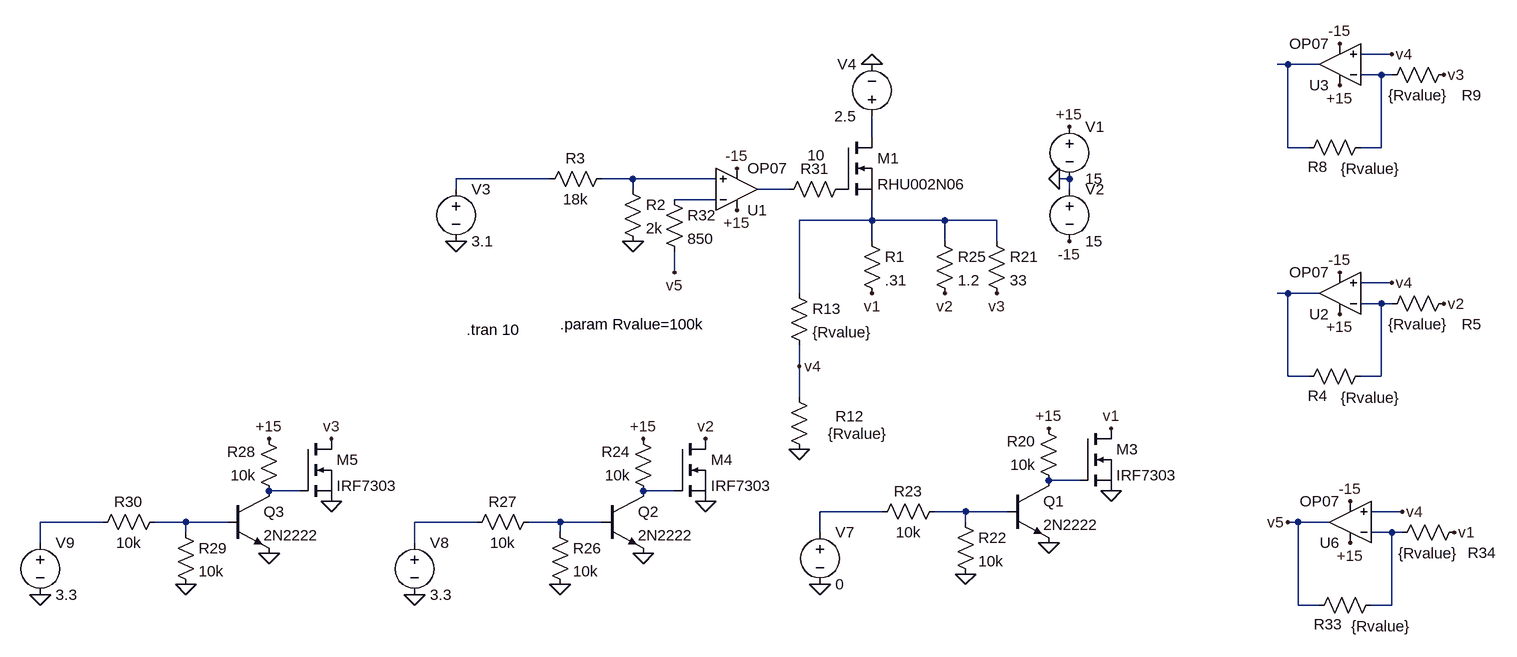
[diagram p0: schematic continuous.asc]
continuous.asc, the LTspice schematic file:
Version 4
SHEET 1 1420 1188
WIRE 1232 -80 1184 -80
WIRE 1072 -64 1056 -64
WIRE 1120 -64 1072 -64
WIRE 1216 -48 1184 -48
WIRE 1232 -48 1216 -48
WIRE 432 48 432 16
WIRE 1072 64 1072 -64
WIRE 1104 64 1072 64
WIRE 1216 64 1216 -48
WIRE 1216 64 1184 64
WIRE -64 112 -208 112
WIRE 64 112 16 112
WIRE 192 112 64 112
WIRE 736 112 720 112
WIRE -208 128 -208 112
WIRE 64 128 64 112
WIRE 304 128 256 128
WIRE 736 128 736 112
WIRE 192 144 128 144
WIRE 432 176 432 144
WIRE 432 176 320 176
WIRE 544 176 432 176
WIRE 624 176 544 176
WIRE 432 208 432 176
WIRE 544 208 544 176
WIRE 624 208 624 176
WIRE 128 256 128 224
WIRE 1232 272 1184 272
WIRE 320 288 320 176
WIRE 1072 288 1056 288
WIRE 1120 288 1072 288
WIRE 1216 304 1184 304
WIRE 1232 304 1216 304
WIRE 320 400 320 368
WIRE 1072 416 1072 288
WIRE 1104 416 1072 416
WIRE 1216 416 1216 304
WIRE 1216 416 1184 416
WIRE 320 448 320 400
WIRE 752 576 704 576
WIRE -448 592 -496 592
WIRE 128 592 80 592
WIRE 448 624 352 624
WIRE 576 624 528 624
WIRE 640 624 576 624
WIRE 1248 624 1200 624
WIRE -752 640 -848 640
WIRE -624 640 -672 640
WIRE -560 640 -624 640
WIRE -176 640 -272 640
WIRE -48 640 -96 640
WIRE 16 640 -48 640
WIRE 576 640 576 624
WIRE 1088 640 1072 640
WIRE 1136 640 1088 640
WIRE -624 656 -624 640
WIRE -48 656 -48 640
WIRE 352 656 352 624
WIRE 1232 656 1200 656
WIRE 1248 656 1232 656
WIRE -848 672 -848 640
WIRE -272 672 -272 640
WIRE 1088 768 1088 640
WIRE 1120 768 1088 768
WIRE 1232 768 1232 656
WIRE 1232 768 1200 768
FLAG 720 112 0
FLAG 736 32 +15
FLAG 736 208 -15
FLAG 224 160 +15
FLAG 224 96 -15
FLAG -208 208 0
FLAG 432 -64 0
FLAG 64 208 0
FLAG 800 496 v1
FLAG 800 592 0
FLAG 704 496 +15
FLAG 704 672 0
FLAG 576 720 0
FLAG 352 736 0
FLAG 176 608 0
FLAG 80 512 +15
FLAG 80 688 0
FLAG -48 736 0
FLAG -272 752 0
FLAG -400 608 0
FLAG -496 512 +15
FLAG -496 688 0
FLAG -624 736 0
FLAG -848 752 0
FLAG 544 288 v2
FLAG 624 288 v3
FLAG 320 400 v4
FLAG 128 256 v5
FLAG 176 512 v2
FLAG -400 512 v3
FLAG 1072 640 v5
FLAG 1168 672 +15
FLAG 1168 608 -15
FLAG 1248 624 v4
FLAG 1328 656 v1
FLAG 432 288 v1
FLAG 1152 320 +15
FLAG 1152 256 -15
FLAG 1232 272 v4
FLAG 1152 -32 +15
FLAG 1152 -96 -15
FLAG 1232 -80 v4
FLAG 1312 304 v2
FLAG 1312 -48 v3
FLAG 320 528 0
SYMBOL Opamps\\OP07 224 192 M180
SYMATTR InstName U1
SYMBOL voltage 736 16 R0
WINDOW 123 0 0 Left 0
WINDOW 39 0 0 Left 0
SYMATTR InstName V1
SYMATTR Value 15
SYMBOL voltage 736 112 R0
WINDOW 123 0 0 Left 0
WINDOW 39 0 0 Left 0
SYMATTR InstName V2
SYMATTR Value 15
SYMBOL nmos 384 48 R0
SYMATTR InstName M1
SYMATTR Value RHU002N06
SYMBOL res 416 192 R0
SYMATTR InstName R1
SYMATTR Value .31
SYMBOL voltage -208 112 R0
WINDOW 123 0 0 Left 0
WINDOW 39 0 0 Left 0
SYMATTR InstName V3
SYMATTR Value 3.1
SYMBOL voltage 432 32 R180
WINDOW 0 24 96 Left 2
WINDOW 3 24 16 Left 2
WINDOW 123 0 0 Left 0
WINDOW 39 0 0 Left 0
SYMATTR InstName V4
SYMATTR Value 2.5
SYMBOL res 48 112 R0
SYMATTR InstName R2
SYMATTR Value 2k
SYMBOL res 32 96 R90
WINDOW 0 0 56 VBottom 2
WINDOW 3 32 56 VTop 2
SYMATTR InstName R3
SYMATTR Value 18k
SYMBOL res 528 192 R0
SYMATTR InstName R25
SYMATTR Value 1.2
SYMBOL res 608 192 R0
SYMATTR InstName R21
SYMATTR Value 33
SYMBOL nmos 752 496 R0
SYMATTR InstName M3
SYMATTR Value IRF7303
SYMBOL npn 640 576 R0
SYMATTR InstName Q1
SYMATTR Value 2N2222
SYMBOL res 720 592 R180
WINDOW 0 36 76 Left 2
WINDOW 3 36 40 Left 2
SYMATTR InstName R20
SYMATTR Value 10k
SYMBOL res 560 624 R0
SYMATTR InstName R22
SYMATTR Value 10k
SYMBOL res 544 608 R90
WINDOW 0 0 56 VBottom 2
WINDOW 3 32 56 VTop 2
SYMATTR InstName R23
SYMATTR Value 10k
SYMBOL voltage 352 640 R0
WINDOW 123 0 0 Left 0
WINDOW 39 0 0 Left 0
SYMATTR InstName V7
SYMATTR Value 0
SYMBOL nmos 128 512 R0
SYMATTR InstName M4
SYMATTR Value IRF7303
SYMBOL npn 16 592 R0
SYMATTR InstName Q2
SYMATTR Value 2N2222
SYMBOL res 96 608 R180
WINDOW 0 36 76 Left 2
WINDOW 3 36 40 Left 2
SYMATTR InstName R24
SYMATTR Value 10k
SYMBOL res -64 640 R0
SYMATTR InstName R26
SYMATTR Value 10k
SYMBOL res -80 624 R90
WINDOW 0 0 56 VBottom 2
WINDOW 3 32 56 VTop 2
SYMATTR InstName R27
SYMATTR Value 10k
SYMBOL voltage -272 656 R0
WINDOW 123 0 0 Left 0
WINDOW 39 0 0 Left 0
SYMATTR InstName V8
SYMATTR Value 3.3
SYMBOL nmos -448 512 R0
SYMATTR InstName M5
SYMATTR Value IRF7303
SYMBOL npn -560 592 R0
SYMATTR InstName Q3
SYMATTR Value 2N2222
SYMBOL res -480 608 R180
WINDOW 0 36 76 Left 2
WINDOW 3 36 40 Left 2
SYMATTR InstName R28
SYMATTR Value 10k
SYMBOL res -640 640 R0
SYMATTR InstName R29
SYMATTR Value 10k
SYMBOL res -656 624 R90
WINDOW 0 0 56 VBottom 2
WINDOW 3 32 56 VTop 2
SYMATTR InstName R30
SYMATTR Value 10k
SYMBOL voltage -848 656 R0
WINDOW 123 0 0 Left 0
WINDOW 39 0 0 Left 0
SYMATTR InstName V9
SYMATTR Value 3.3
SYMBOL res 400 112 R90
WINDOW 0 0 56 VBottom 2
WINDOW 3 -52 54 VTop 2
SYMATTR InstName R31
SYMATTR Value 10
SYMBOL res 112 128 R0
SYMATTR InstName R32
SYMATTR Value 850
SYMBOL Opamps\\OP07 1168 704 R180
SYMATTR InstName U6
SYMBOL res 1104 784 R270
WINDOW 0 -29 30 VTop 2
WINDOW 3 -1 111 VBottom 2
SYMATTR InstName R33
SYMATTR Value {Rvalue}
SYMBOL res 1232 672 R270
WINDOW 0 -31 139 VTop 2
WINDOW 3 0 56 VBottom 2
SYMATTR InstName R34
SYMATTR Value {Rvalue}
SYMBOL Opamps\\OP07 1152 352 R180
SYMATTR InstName U2
SYMBOL res 1088 432 R270
WINDOW 0 -29 30 VTop 2
WINDOW 3 -1 111 VBottom 2
SYMATTR InstName R4
SYMATTR Value {Rvalue}
SYMBOL res 1216 320 R270
WINDOW 0 -31 139 VTop 2
WINDOW 3 0 56 VBottom 2
SYMATTR InstName R5
SYMATTR Value {Rvalue}
SYMBOL Opamps\\OP07 1152 0 R180
SYMATTR InstName U3
SYMBOL res 1088 80 R270
WINDOW 0 -29 30 VTop 2
WINDOW 3 -1 111 VBottom 2
SYMATTR InstName R8
SYMATTR Value {Rvalue}
SYMBOL res 1216 -32 R270
WINDOW 0 -31 139 VTop 2
WINDOW 3 0 56 VBottom 2
SYMATTR InstName R9
SYMATTR Value {Rvalue}
SYMBOL res 336 544 R180
WINDOW 3 -120 40 Left 2
WINDOW 0 -84 67 Left 2
SYMATTR Value {Rvalue}
SYMATTR InstName R12
SYMBOL res 304 272 R0
SYMATTR InstName R13
SYMATTR Value {Rvalue}
TEXT -192 344 Left 2 !.tran 10
TEXT -48 336 Left 2 !.param Rvalue=100k

The netlist it stands for:
* continuous.asc
XU1 N005 N007 +15 -15 N006 LT1001  ; OP07, pins In+ In- V+ V- OUT
V1 +15 0 15
V2 0 -15 15
M1 N003 P001 N008 N008 RHU002N06
R1 N008 v1 .31
V3 N004 0 3.1
V4 N003 0 2.5
R2 N005 0 2k
R3 N005 N004 18k
R25 N008 v2 1.2
R21 N008 v3 33
M3 v1 N011 0 0 IRF7303
Q1 N011 N015 0 0 2N2222
R20 N011 +15 10k
R22 N015 0 10k
R23 N015 N014 10k
V7 N014 0 0
M4 v2 N013 0 0 IRF7303
Q2 N013 N019 0 0 2N2222
R24 N013 +15 10k
R26 N019 0 10k
R27 N019 N018 10k
V8 N018 0 3.3
M5 v3 N012 0 0 IRF7303
Q3 N012 N017 0 0 2N2222
R28 N012 +15 10k
R29 N017 0 10k
R30 N017 N016 10k
V9 N016 0 3.3
R31 P001 N006 10
R32 N007 v5 850
XU6 v4 N020 +15 -15 v5 LT1001  ; OP07, pins In+ In- V+ V- OUT
R33 v5 N020 {Rvalue}
R34 N020 v1 {Rvalue}
XU2 v4 N010 +15 -15 N009 LT1001  ; OP07, pins In+ In- V+ V- OUT
R4 N009 N010 {Rvalue}
R5 N010 v2 {Rvalue}
XU3 v4 N002 +15 -15 N001 LT1001  ; OP07, pins In+ In- V+ V- OUT
R8 N001 N002 {Rvalue}
R9 N002 v3 {Rvalue}
R12 0 v4 {Rvalue}
R13 N008 v4 {Rvalue}
.model NPN NPN
.model PNP PNP
.lib standard.bjt
.model NMOS NMOS
.model PMOS PMOS
.lib standard.mos
.tran 10
.param Rvalue=100k
.lib LTC.lib
.backanno
.end